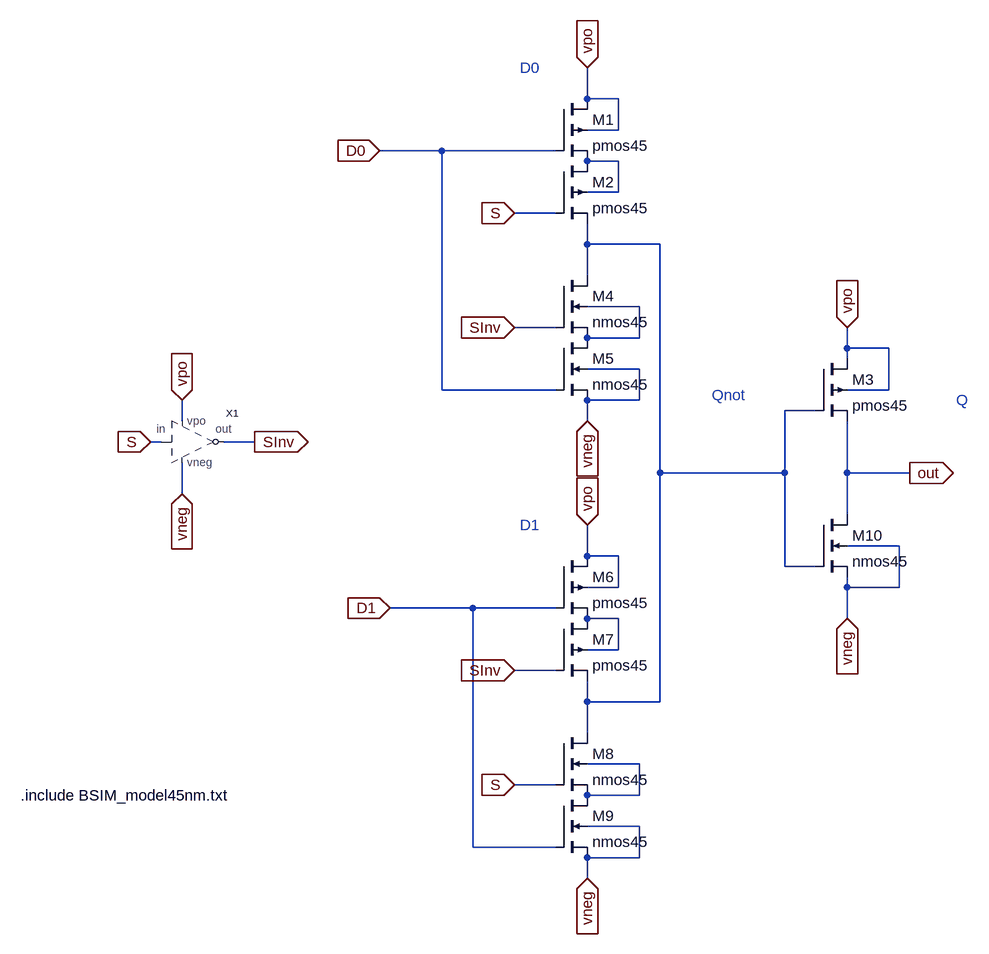
[diagram p0: schematic Multiplexer.asc]
Multiplexer.asc, the LTspice schematic file:
Version 4
SHEET 1 672 1204
WIRE 48 -96 48 -144
WIRE 96 -96 48 -96
WIRE 96 -48 96 -96
WIRE 96 -48 48 -48
WIRE -176 -16 -272 -16
WIRE 0 -16 -176 -16
WIRE 96 0 48 0
WIRE 96 48 96 0
WIRE 96 48 48 48
WIRE 0 80 -64 80
WIRE 48 128 48 96
WIRE 160 128 48 128
WIRE 48 176 48 128
WIRE 128 224 48 224
WIRE 0 256 -64 256
WIRE 128 272 128 224
WIRE 128 272 48 272
WIRE 448 288 448 256
WIRE 512 288 448 288
WIRE 448 304 448 288
WIRE 128 320 48 320
WIRE -176 352 -176 -16
WIRE 0 352 -176 352
WIRE 512 352 512 288
WIRE 512 352 448 352
WIRE 128 368 128 320
WIRE 128 368 48 368
WIRE 400 384 352 384
WIRE -576 400 -576 368
WIRE 48 400 48 368
WIRE -608 432 -624 432
WIRE -464 432 -512 432
WIRE 160 480 160 128
WIRE 352 480 352 384
WIRE 352 480 160 480
WIRE 448 480 448 400
WIRE 544 480 448 480
WIRE -576 512 -576 464
WIRE 448 544 448 480
WIRE 528 592 448 592
WIRE 48 608 48 560
WIRE 96 608 48 608
WIRE 352 624 352 480
WIRE 400 624 352 624
WIRE 96 656 96 608
WIRE 96 656 48 656
WIRE 448 656 448 640
WIRE 528 656 528 592
WIRE 528 656 448 656
WIRE -128 688 -256 688
WIRE 0 688 -128 688
WIRE 96 704 48 704
WIRE 448 704 448 656
WIRE 96 752 96 704
WIRE 96 752 48 752
WIRE 0 784 -64 784
WIRE 48 832 48 800
WIRE 160 832 160 480
WIRE 160 832 48 832
WIRE 48 880 48 832
WIRE 128 928 48 928
WIRE 0 960 -64 960
WIRE 128 976 128 928
WIRE 128 976 48 976
WIRE 128 1024 48 1024
WIRE -128 1056 -128 688
WIRE 0 1056 -128 1056
WIRE 128 1072 128 1024
WIRE 128 1072 48 1072
WIRE 48 1104 48 1072
FLAG 48 400 vneg
IOPIN 48 400 In
FLAG -64 80 S
IOPIN -64 80 In
FLAG -272 -16 D0
IOPIN -272 -16 In
FLAG 48 1104 vneg
IOPIN 48 1104 In
FLAG -624 432 S
IOPIN -624 432 In
FLAG -256 688 D1
IOPIN -256 688 In
FLAG 48 560 vpo
IOPIN 48 560 In
FLAG 48 -144 vpo
IOPIN 48 -144 In
FLAG 448 704 vneg
IOPIN 448 704 In
FLAG 448 256 vpo
IOPIN 448 256 In
FLAG 544 480 out
IOPIN 544 480 Out
FLAG -576 512 vneg
IOPIN -576 512 In
FLAG -576 368 vpo
IOPIN -576 368 In
FLAG -464 432 SInv
IOPIN -464 432 Out
FLAG -64 256 SInv
IOPIN -64 256 In
FLAG -64 784 SInv
IOPIN -64 784 In
FLAG -64 960 S
IOPIN -64 960 In
SYMBOL pmos4 0 -96 R0
SYMATTR InstName M1
SYMATTR Value pmos45
SYMATTR Value2 l=60nm w=400nm
SYMBOL pmos4 0 0 R0
SYMATTR InstName M2
SYMATTR Value pmos45
SYMATTR Value2 l=60nm w=400nm
SYMBOL pmos4 400 304 R0
SYMATTR InstName M3
SYMATTR Value pmos45
SYMATTR Value2 l=60nm w=400nm
SYMBOL nmos4 0 176 R0
SYMATTR InstName M4
SYMATTR Value nmos45
SYMATTR Value2 l=60nm w=200nm
SYMBOL nmos4 0 272 R0
SYMATTR InstName M5
SYMATTR Value nmos45
SYMATTR Value2 l=60nm w=200nm
SYMBOL pmos4 0 608 R0
SYMATTR InstName M6
SYMATTR Value pmos45
SYMATTR Value2 l=60nm w=400nm
SYMBOL pmos4 0 704 R0
SYMATTR InstName M7
SYMATTR Value pmos45
SYMATTR Value2 l=60nm w=400nm
SYMBOL nmos4 0 880 R0
SYMATTR InstName M8
SYMATTR Value nmos45
SYMATTR Value2 l=60nm w=200nm
SYMBOL nmos4 0 976 R0
SYMATTR InstName M9
SYMATTR Value nmos45
SYMATTR Value2 l=60nm w=200nm
SYMBOL nmos4 400 544 R0
SYMATTR InstName M10
SYMATTR Value nmos45
SYMATTR Value2 l=60nm w=200nm
SYMBOL Inverter -576 432 R0
SYMATTR InstName X1
TEXT -56 -144 Left 2 ;D0
TEXT -56 560 Left 2 ;D1
TEXT 240 360 Left 2 ;Qnot
TEXT 616 368 Left 2 ;Q
TEXT -824 976 Left 2 !.include BSIM_model45nm.txt

The netlist it stands for:
* Multiplexer.asc
M1 vpo D0 N001 vpo pmos45 l=60nm w=400nm
M2 N001 S N002 N001 pmos45 l=60nm w=400nm
M3 vpo N002 out vpo pmos45 l=60nm w=400nm
M4 N002 SInv N003 N003 nmos45 l=60nm w=200nm
M5 N003 D0 vneg vneg nmos45 l=60nm w=200nm
M6 vpo D1 N004 vpo pmos45 l=60nm w=400nm
M7 N004 SInv N002 N004 pmos45 l=60nm w=400nm
M8 N002 S N005 N005 nmos45 l=60nm w=200nm
M9 N005 D1 vneg vneg nmos45 l=60nm w=200nm
M10 out N002 vneg vneg nmos45 l=60nm w=200nm
XX1 S SInv vpo vneg Inverter  ; pins in out vpo vneg
.model NMOS NMOS
.model PMOS PMOS
.lib standard.mos
* D0
* D1
* Qnot
* Q
.include BSIM_model45nm.txt
.backanno
.end